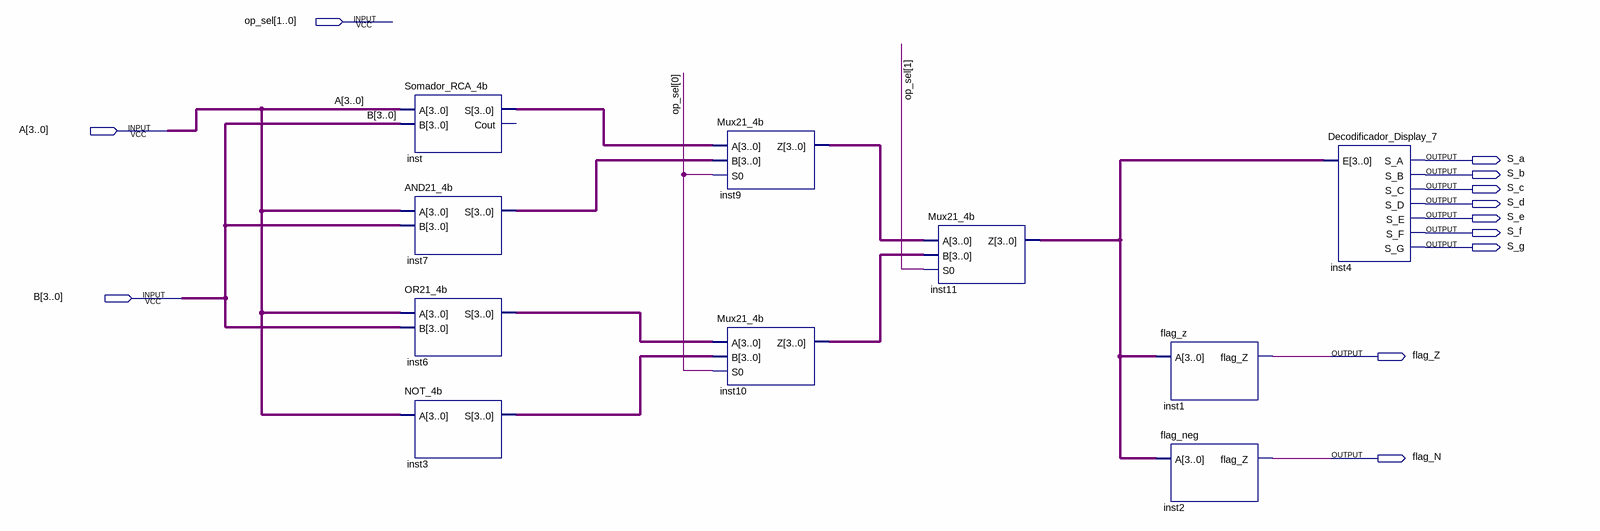
[diagram p0: schematic sheet]
// Quartus schematic ULA.bdf as structural Verilog: 10 symbols, 12 pins
module ULA (
  input  [1:0] op_sel,
  input  [3:0] A,
  input  [3:0] B,
  output S_a,
  output S_b,
  output S_c,
  output S_d,
  output S_e,
  output S_f,
  output S_g,
  output flag_Z,
  output flag_N
);

  wire [3:0] inst3_s, inst6_s, inst7_s, inst9_z, inst10_z, inst11_z, inst_s;

  Somador_RCA_4b inst (.A(A), .B(B), .S(inst_s));  // open: Cout
  AND21_4b inst7 (.A(A), .B(B), .S(inst7_s));
  OR21_4b inst6 (.A(A), .B(B), .S(inst6_s));
  NOT_4b inst3 (.A(A), .S(inst3_s));
  Mux21_4b inst9 (.A(inst_s), .B(inst7_s), .S0(op_sel[0]), .Z(inst9_z));
  Mux21_4b inst10 (.A(inst6_s), .B(inst3_s), .S0(op_sel[0]), .Z(inst10_z));
  Mux21_4b inst11 (.A(inst9_z), .B(inst10_z), .S0(op_sel[1]), .Z(inst11_z));
  flag_z inst1 (.A(inst11_z), .flag_Z(flag_Z));
  flag_neg inst2 (.A(inst11_z), .flag_Z(flag_N));
  Decodificador_Display_7 inst4 (
    .E(inst11_z), .S_A(S_a), .S_B(S_b), .S_C(S_c), .S_D(S_d), .S_E(S_e), .S_F(S_f), .S_G(S_g));
endmodule
